# EasyEDA Pro project esp-college-project_bkymsryt-aeef78a5.epro, schematic SCH-ShuttleBoard-BME690-V1_1
Board Name: ShuttleBoard-BME690-V1_0; Create Date: 2025-10-17; Page Name: P1; Project Name: ESP-SensairShuttle; Schematic Name: SCH-ShuttleBoard-BME690-V1_0; Update Date: 2025-10-17; Company: Espressif
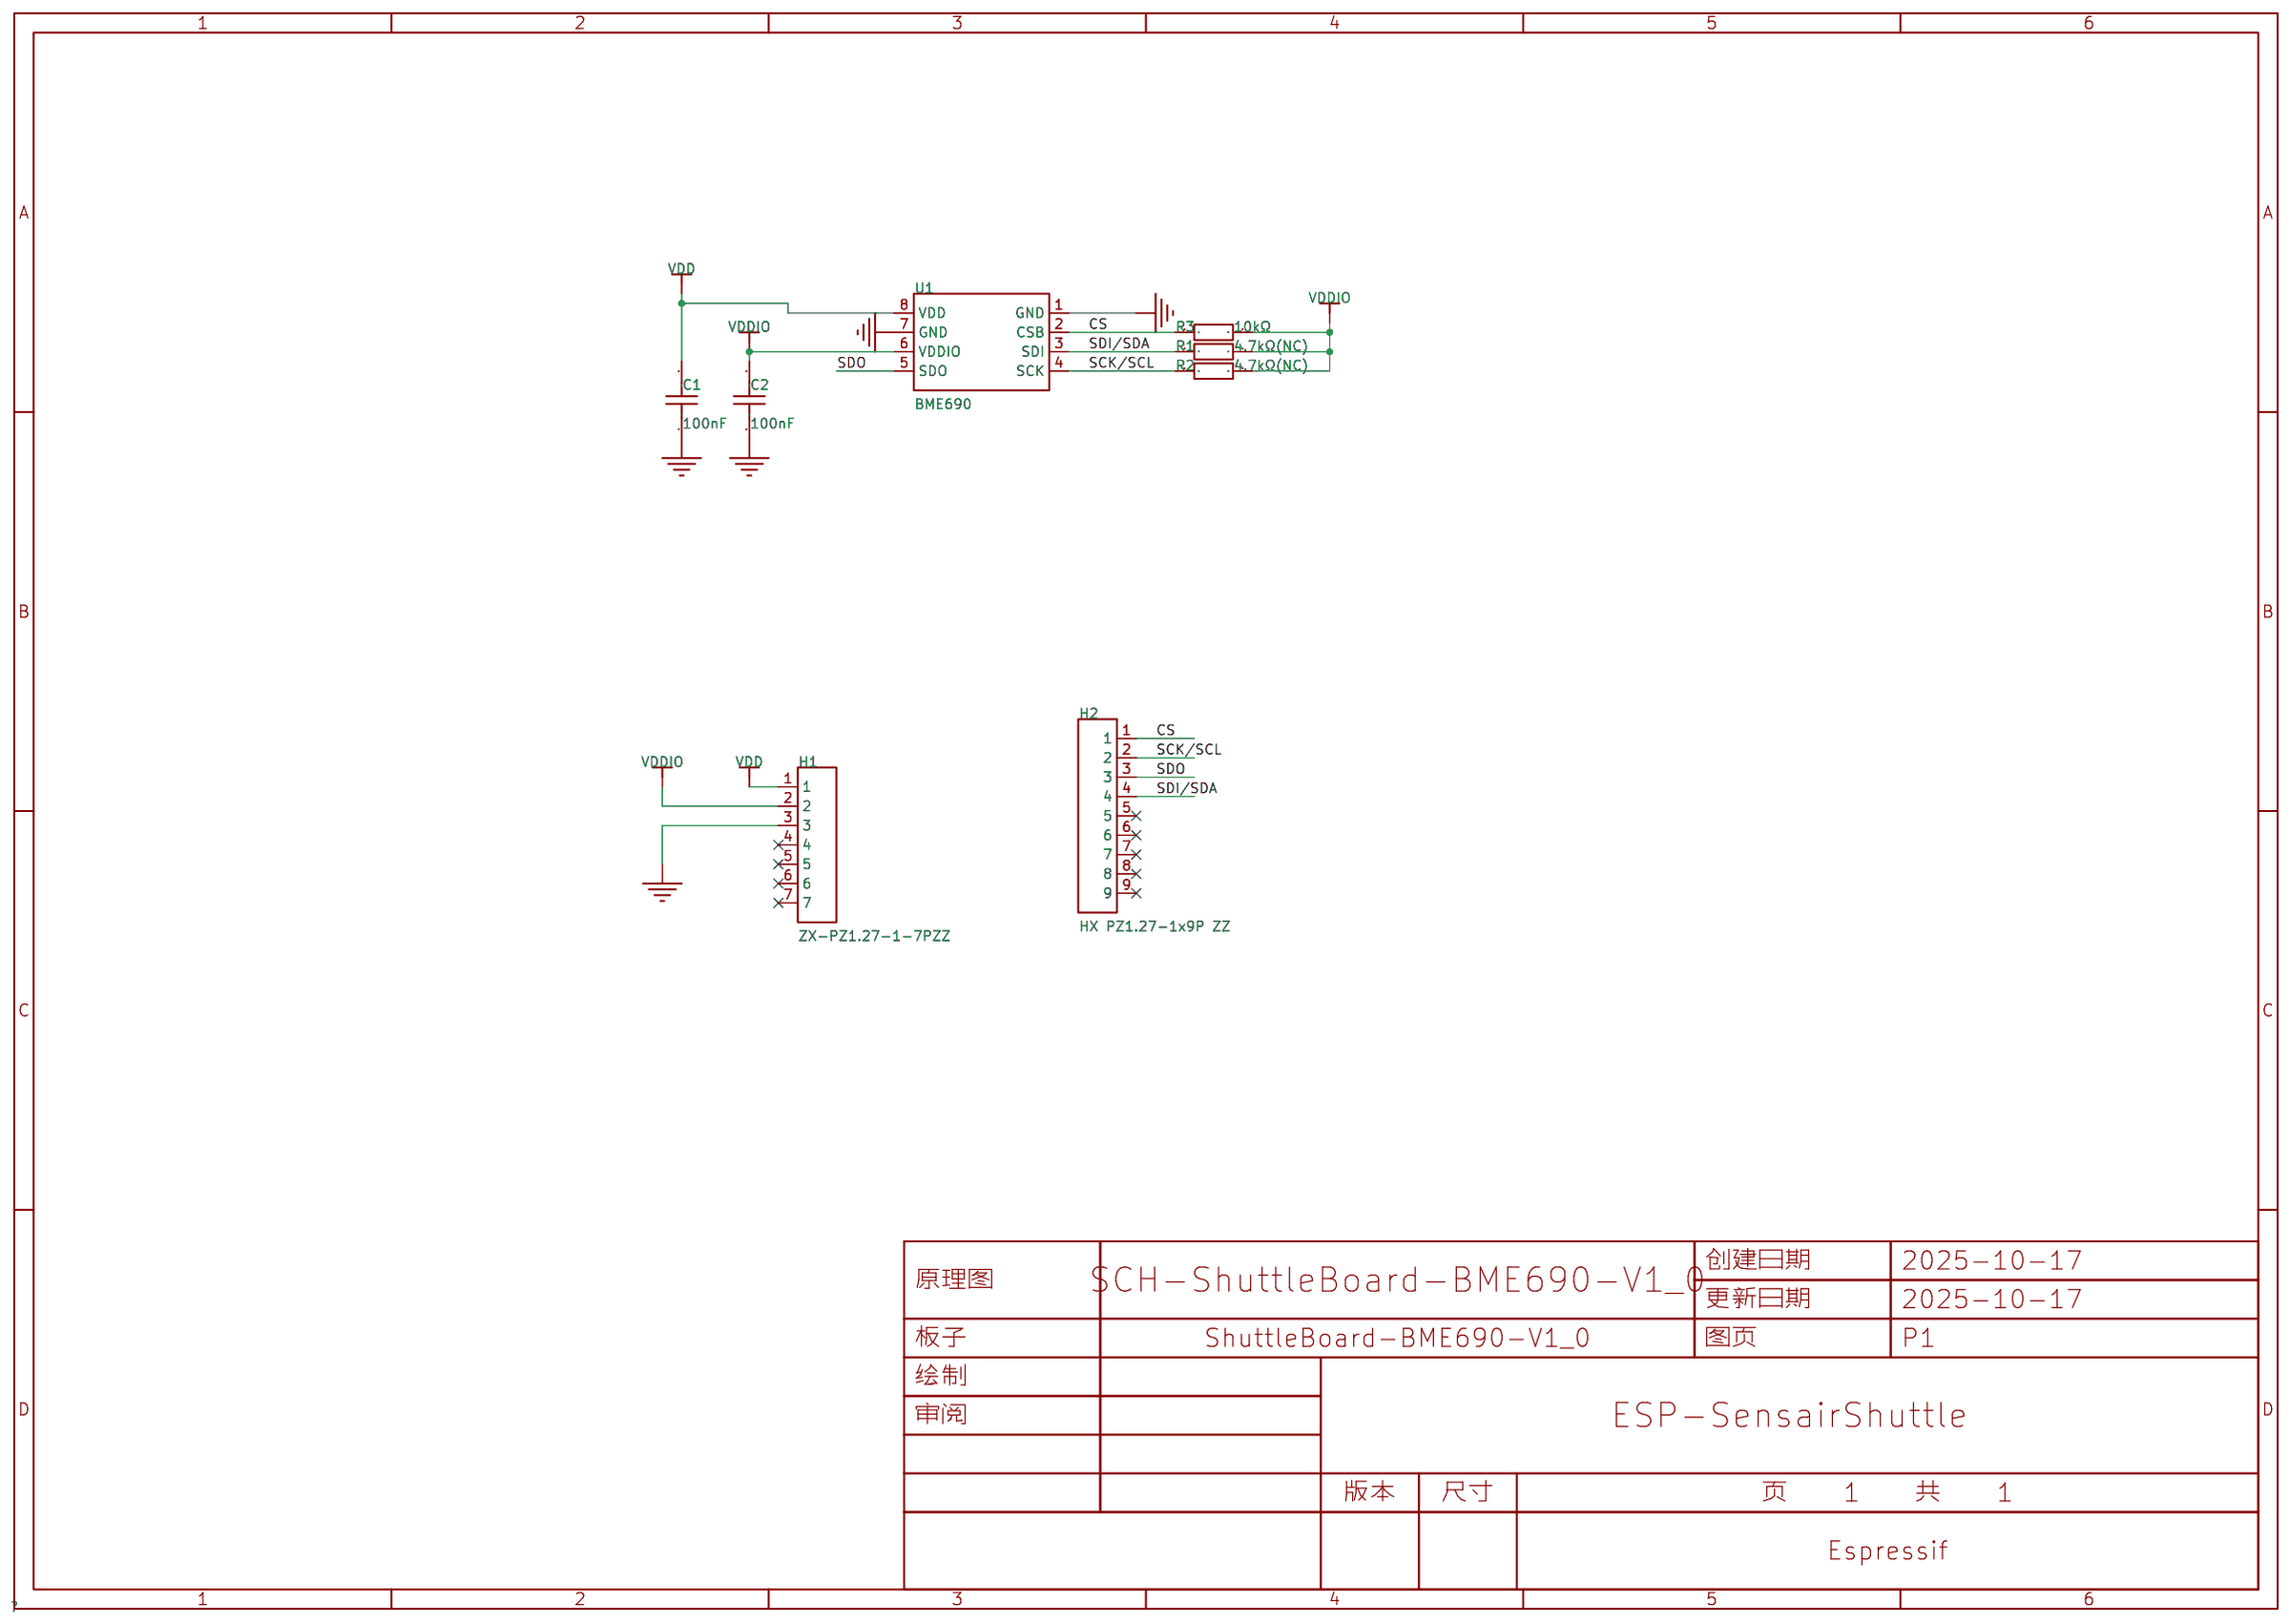
[diagram p4: schematic sheet]

## Parts
C1  100nF  [C0402]
C2  100nF  [C0402]
H1  ZX-PZ1.27-1-7PZZ  [HDR-TH_7P-P1.27-V-M-2]
H2  HX PZ1.27-1x9P ZZ  [HDR-TH_9P-P1.27-V-M]
R1  4.7kΩ(NC)  [R0402]
R2  4.7kΩ(NC)  [R0402]
R3  10kΩ  [R0402_1]
U1  BME690  [LGA-8_L3.0-W3.0-P0.80-TR-1]

## Library data of the parts
C1 C2 = CL05B104KO5NNNC: 容值:100nF;精度:±10%;额定电压:16V;材质(温度系数):X7R;; LCSC Part Name: 100nF ±10% 16V; Supplier Part: C1525; Manufacturer: SAMSUNG(三星); Supplier Footprint: 0402; JLCPCB Part Class: 基础库; Datasheet: https://atta.szlcsc.com/upload/public/pdf/source/20160218/1457707763339.pdf; Supplier: LCSC; Tolerance: ±10%; Voltage Rated: 16V; Temperature Coefficient: X7R
H1 = ZX-PZ1.27-1-7PZZ: 插针结构:1x7P;间距:1.27mm;行距:-;圆针/方针:方针;安装方式:直插;排数:单排;总PIN位数:7P;额定电流:1A;额定电压:-;配合针长度:3.9mm;塑高:1mm;端接针长度:2.3mm;触头材质:黄铜;触头镀层:金;工作温度:-40℃~+105℃;颜色:黑色;; LCSC Part Name: 1x7P 间距:1.27mm 方针 直插; Supplier Part: C41370739; Manufacturer: Megastar(兆星); Supplier Footprint: 插件,P=1.27mm; JLCPCB Part Class: 扩展库; Datasheet: https://atta.szlcsc.com/upload/public/pdf/source/20240828/99A84DD00A3C3BDAF37BC6A7479E534F.pdf; Supplier: LCSC; Pin Structure: 1x7P; Pitch: 1.27mm; Circluar Pins/Square Pins: 方针; Mounting Type: 直插; Number of Rows: 单排; Number of Pins: 7P; Current Rating: 1A; Length of Mating Pin: 3.9mm; Insulation Height: 1mm; Length of End Connection Pin: 2.3mm; Contact Material: 黄铜; Contact Plating: 金; Operating Temperature: -40℃~+105℃; Color: 黑色
H2 = HX PZ1.27-1x9P ZZ: 插针结构:1x9P;间距:1.27mm;行距:-;圆针/方针:方针;安装方式:直插;排数:单排;总PIN位数:9P;额定电流:1A;额定电压:-;配合针长度:3.9mm;塑高:1mm;端接针长度:2.3mm;触头材质:磷青铜;触头镀层:金;工作温度:-40℃~+105℃;颜色:黑色;; LCSC Part Name: 1x9P 间距:1.27mm 方针 直插; Supplier Part: C22438106; Manufacturer: hanxia(韩下); Supplier Footprint: 插件,P=1.27mm; JLCPCB Part Class: 扩展库; Datasheet: https://atta.szlcsc.com/upload/public/pdf/source/20240522/EDC4EB74ABA2F7724AE2DA5150C3160E.pdf; Supplier: LCSC; Pin Structure: 1x9P; Pitch: 1.27mm; Circluar Pins/Square Pins: 方针; Mounting Type: 直插; Number of Rows: 单排; Number of Pins: 9P; Current Rating: 1A; Length of Mating Pin: 3.9mm; Insulation Height: 1mm; Length of End Connection Pin: 2.3mm; Contact Material: 磷青铜; Contact Plating: 金; Operating Temperature: -40℃~+105℃; Color: 黑色
R1 R2 = 0402WGF4701TCE: 电阻类型:厚膜电阻;阻值:4.7kΩ;精度:±1%;功率:62.5mW;最大工作电压:50V;温度系数:±100ppm/℃;; LCSC Part Name: 4.7kΩ ±1% 62.5mW 厚膜电阻; Supplier Part: C25900; Manufacturer: UNI-ROYAL(厚声); Supplier Footprint: 0402; JLCPCB Part Class: Basic Part; Datasheet: https://atta.szlcsc.com/upload/public/pdf/source/20200306/C422600_1E6D84923E4A46A82E41ADD87F860B5C.pdf; Supplier: LCSC; Type: 厚膜电阻; Tolerance: ±1%; Power(Watts): 62.5mW; Overload Voltage (Max): 50V; Temperature Coefficient: ±100ppm/℃; Operating Temperature Range: -55℃~+155℃; Check: false
R3 = 0402WGF1002TCE: 电阻类型:厚膜电阻;阻值:10kΩ;精度:±1%;功率:62.5mW;最大工作电压:50V;温度系数:±100ppm/℃;; LCSC Part Name: 厚膜电阻 10kΩ ±1% 62.5mW; Supplier Part: C25744; Manufacturer: UNI-ROYAL(厚声); Supplier Footprint: 0402; JLCPCB Part Class: Basic Part; Datasheet: https://atta.szlcsc.com/upload/public/pdf/source/20200306/C422600_1E6D84923E4A46A82E41ADD87F860B5C.pdf; Supplier: LCSC; Type: 厚膜电阻; Tolerance: ±1%; Power(Watts): 62.5mW; Temperature Coefficient: ±100ppm/℃; Overload Voltage (Max): 50V; Operating Temperature Range: -55℃~+155℃
U1 = BME690: Supplier Part: C42431867; Manufacturer: Bosch(博世); Supplier Footprint: LGA-8(3x3); Datasheet: https://item.szlcsc.com/datasheet/BME690/44459017.html; Supplier: LCSC

## Nets
GND: C1.1 C2.1 H1.3 U1.1(GND) U1.7(GND)
VDD: C1.2 H1.1 U1.8(VDD)
VDDIO: C2.2 H1.2 R1.1 R2.1 R3.2 U1.6(VDDIO)
CS: H2.1 R3.1 U1.2(CSB)
SCK/SCL: H2.2 R2.2 U1.4(SCK)
SDI/SDA: H2.4 R1.2 U1.3(SDI)
SDO: H2.3 U1.5(SDO)

Not connected (* = marked no-connect by the designer): H1 4* 5* 6* 7*; H2 5* 6* 7* 8* 9*
